# Altium schematic sheet 15_Radar_interfaces_and_QSPI.SchDoc
size 289 x 396 mm
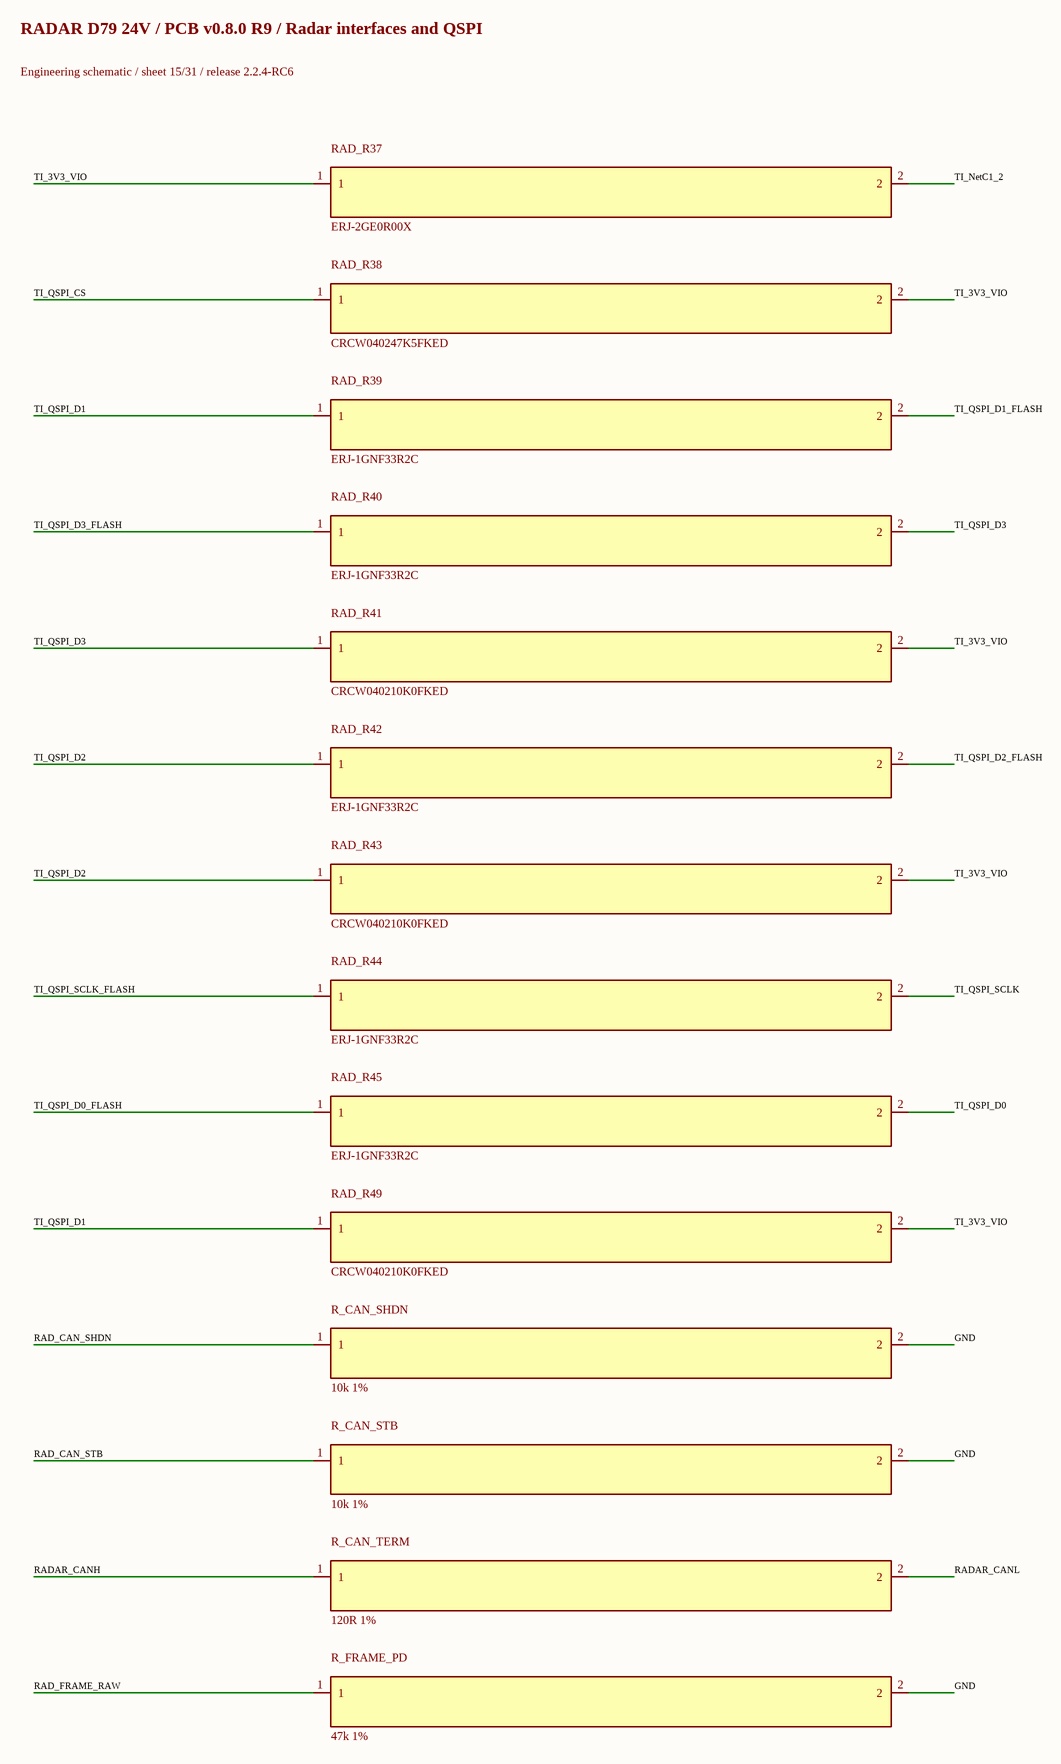
[diagram p0: 15_Radar_interfaces_and_QSPI.SchDoc]

## Parts
R_CAN_SHDN  10k 1%  [R_0603_1608Metric]
R_CAN_STB  10k 1%  [R_0603_1608Metric]
R_CAN_TERM  120R 1%  [R_0603_1608Metric]
R_FRAME_PD  47k 1%  [R_0603_1608Metric]
RAD_R37  ERJ-2GE0R00X  [0402L]
RAD_R38  CRCW040247K5FKED  [0402L]
RAD_R39  ERJ-1GNF33R2C  [FP-ERJ-1GNF33R2C_0201-MFG]
RAD_R40  ERJ-1GNF33R2C  [FP-ERJ-1GNF33R2C_0201-MFG]
RAD_R41  CRCW040210K0FKED  [0402L]
RAD_R42  ERJ-1GNF33R2C  [FP-ERJ-1GNF33R2C_0201-MFG]
RAD_R43  CRCW040210K0FKED  [0402L]
RAD_R44  ERJ-1GNF33R2C  [FP-ERJ-1GNF33R2C_0201-MFG]
RAD_R45  ERJ-1GNF33R2C  [FP-ERJ-1GNF33R2C_0201-MFG]
RAD_R49  CRCW040210K0FKED  [0402L]

## Nets
GND: R_CAN_SHDN.2 R_CAN_STB.2 R_FRAME_PD.2
RAD_CAN_SHDN: R_CAN_SHDN.1
RAD_CAN_STB: R_CAN_STB.1
RAD_FRAME_RAW: R_FRAME_PD.1
RADAR_CANH: R_CAN_TERM.1
RADAR_CANL: R_CAN_TERM.2
TI_3V3_VIO: RAD_R37.1 RAD_R38.2 RAD_R41.2 RAD_R43.2 RAD_R49.2
TI_NetC1_2: RAD_R37.2
TI_QSPI_CS: RAD_R38.1
TI_QSPI_D0: RAD_R45.2
TI_QSPI_D0_FLASH: RAD_R45.1
TI_QSPI_D1: RAD_R39.1 RAD_R49.1
TI_QSPI_D1_FLASH: RAD_R39.2
TI_QSPI_D2: RAD_R42.1 RAD_R43.1
TI_QSPI_D2_FLASH: RAD_R42.2
TI_QSPI_D3: RAD_R40.2 RAD_R41.1
TI_QSPI_D3_FLASH: RAD_R40.1
TI_QSPI_SCLK: RAD_R44.2
TI_QSPI_SCLK_FLASH: RAD_R44.1

## Notes on the sheet
- RADAR D79 24V / PCB v0.8.0 R9 / Radar interfaces and QSPI
- Engineering schematic / sheet 15/31 / release 2.2.4-RC6